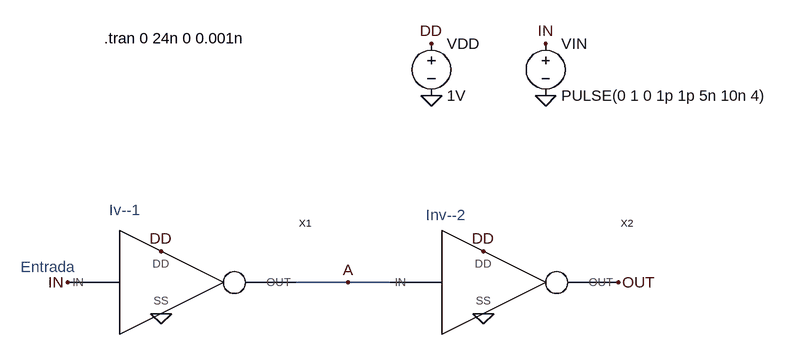
[diagram p0: schematic 2a.asc]
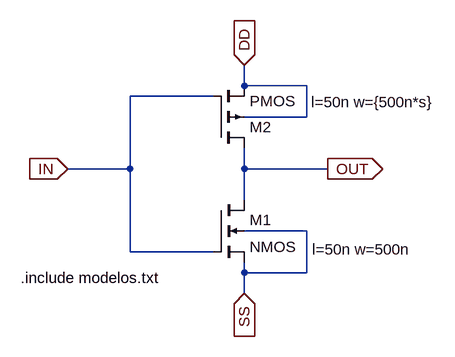
[diagram p1: sub-circuit inversorp.asc]
2a.asc, the LTspice schematic file:
Version 4
SHEET 1 1000 680
WIRE 336 160 256 160
WIRE 400 160 336 160
FLAG 464 -128 0
FLAG 640 -128 0
FLAG 48 208 0
FLAG 464 -208 DD
FLAG 48 112 DD
FLAG 640 -208 IN
FLAG -96 160 IN
FLAG 336 160 A
FLAG 544 208 0
FLAG 752 160 OUT
FLAG 544 112 DD
SYMBOL inversorp -16 160 R0
SYMATTR InstName X1
SYMBOL voltage 464 -224 R0
WINDOW 123 0 0 Left 0
WINDOW 39 0 0 Left 0
SYMATTR InstName VDD
SYMATTR Value 1V
SYMBOL voltage 640 -224 R0
WINDOW 123 0 0 Left 0
WINDOW 39 0 0 Left 0
SYMATTR InstName VIN
SYMATTR Value PULSE(0 1 0 1p 1p 5n 10n 4)
SYMBOL inversorp 480 160 R0
SYMATTR InstName X2
TEXT -40 -216 Left 2 !.tran 0 24n 0 0.001n
TEXT -168 136 Left 2 ;Entrada
TEXT -32 48 Left 2 ;Iv--1
TEXT 456 56 Left 2 ;Inv--2

inversorp.asc, the sub-circuit schematic file:
Version 4
SHEET 1 1048 680
WIRE 112 32 112 0
WIRE 208 32 112 32
WIRE 64 48 -64 48
WIRE 208 80 208 32
WIRE 208 80 112 80
WIRE -64 160 -64 48
WIRE -64 160 -160 160
WIRE 112 160 112 128
WIRE 240 160 112 160
WIRE 112 208 112 160
WIRE 208 256 112 256
WIRE -64 288 -64 160
WIRE 64 288 -64 288
WIRE 112 320 112 304
WIRE 208 320 208 256
WIRE 208 320 112 320
WIRE 112 352 112 320
FLAG 112 0 DD
IOPIN 112 0 In
FLAG -160 160 IN
IOPIN -160 160 In
FLAG 240 160 OUT
IOPIN 240 160 Out
FLAG 112 352 SS
IOPIN 112 352 In
SYMBOL nmos4 64 208 R0
WINDOW 123 152 76 Left 2
WINDOW 0 56 31 Left 2
SYMATTR Value2 l=50n w=500n
SYMATTR InstName M1
SYMBOL pmos4 64 128 M180
WINDOW 123 151 71 Left 2
SYMATTR Value2 l=50n w={500n*s}
SYMATTR InstName M2
TEXT -232 328 Left 2 !.include modelos.txt

The netlist it stands for:
* 2a.asc
XX1 DD 0 IN A inversorp params: s=2
VDD DD 0 1V
VIN IN 0 PULSE(0 1 0 1p 1p 5n 10n 4)
XX2 DD 0 A OUT inversorp params: s=2

* block symbol definitions
.subckt inversorp DD SS IN OUT
M1 OUT IN SS SS NMOS l=50n w=500n
M2 OUT IN DD DD PMOS l=50n w={500n*s}
.include modelos.txt
.ends inversorp

.model NMOS NMOS
.model PMOS PMOS
.lib standard.mos
.tran 0 24n 0 0.001n
* Entrada
* Iv--1
* Inv--2
.backanno
.end